# Altium schematic sheet Upliance_Power_sequnecing_assignment1_SCH.schdoc
size 426 x 302 mm; Name: A_A3; Symbol: A_A3; Device: A_A3; @Project Name: POWER SEQUENCING; REV: 1.0; Date: 2025-04-19; Sheet: 1/1; Draw By: Yusuf; Convert to PCB: yes *; Add into BOM: yes; spicePre: .; SheetNumber: 2; SheetTotal: 17
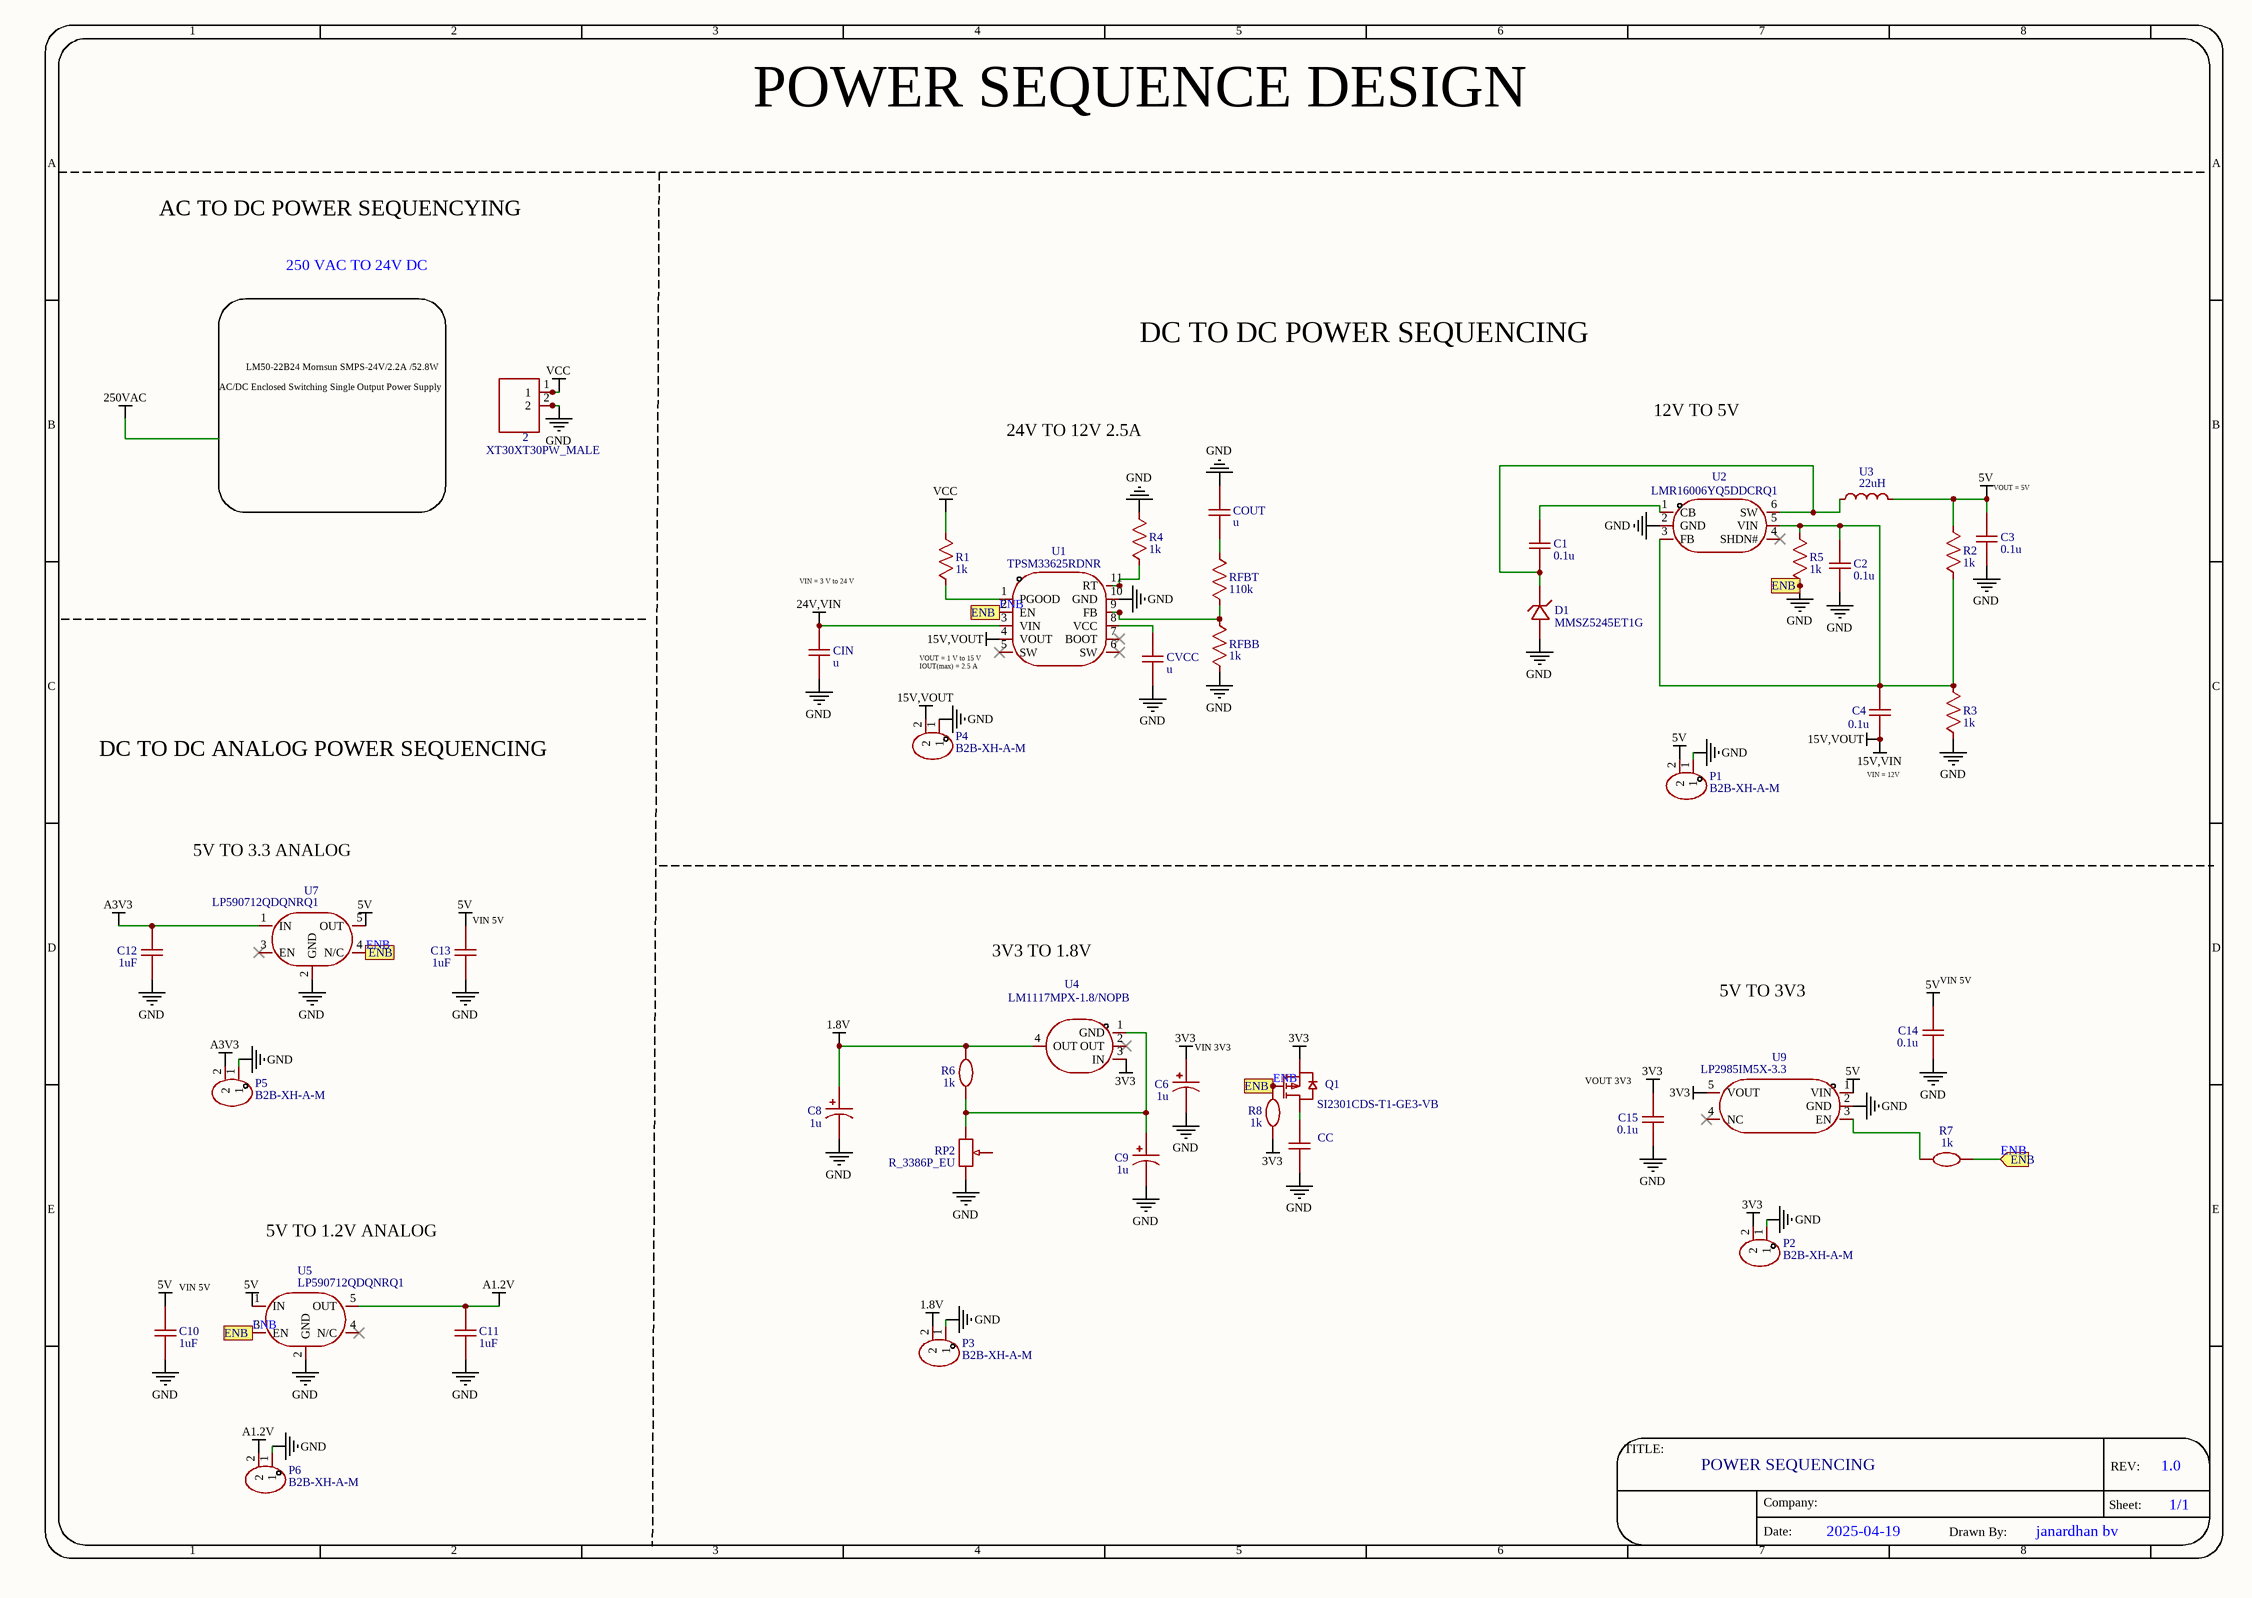
[diagram p0: Upliance_Power_sequnecing_assignment1_SCH.schdoc]

## Parts
2  XT30XT30PW_MALE
C1  0.1u  [C0603]
C2  0.1u  [C0603]
C3  0.1u  [C0603]
C4  0.1u  [C0603]
C6  1u  [CASE-A_3216]
C8  1u  [CASE-A_3216]
C9  1u  [CASE-A_3216]
C10  1uF  [C0603]
C11  1uF  [C0603]
C12  1uF  [C0603]
C13  1uF  [C0603]
C14  0.1u  [C0603]
C15  0.1u  [C0603]
CC  0.1u  [C0603]  (value not drawn)
CIN  u  [C0603]
COUT  u  [C0603]
CVCC  u  [C0603]
D1  MMSZ5245ET1G  [SOD-123_L2.7-W1.6-LS3.7-RD]
P1  B2B-XH-A-M  [CONN-TH_B2B-XH-A-M]
P2  B2B-XH-A-M  [CONN-TH_B2B-XH-A-M]
P3  B2B-XH-A-M  [CONN-TH_B2B-XH-A-M]
P4  B2B-XH-A-M  [CONN-TH_B2B-XH-A-M]
P5  B2B-XH-A-M  [CONN-TH_B2B-XH-A-M]
P6  B2B-XH-A-M  [CONN-TH_B2B-XH-A-M]
Q1  SI2301CDS-T1-GE3-VB  [SOT-23-3_L2.9-W1.3-P1.90-LS2.4-BR]
R1  1k  [R0603]
R2  1k  [R0603]
R3  1k  [R0603]
R4  1k  [R0603]
R5  1k  [R0603]
R6  1k  [R0603]
R7  1k  [R0603]
R8  1k  [R0603]
RFBB  1k  [R0603]
RFBT  110k  [R0603]
RP2  R_3386P_EU  [RES-ADJ-TH_3386P]
U1  TPSM33625RDNR  [QFN-11_L4.5-W3.5-P0.50-TL_TPSM365R6FRDNR]
U2  LMR16006YQ5DDCRQ1  [TSOT-23-6_L2.9-W1.6-P0.95-LS2.8-BR]
U3  22uH  [IND-SMD_L2.1-W1.5]
U4  LM1117MPX-1.8/NOPB  [SOT-223-4_L6.5-W3.5-P2.30-LS7.0-BR]
U5  LP590712QDQNRQ1  [SOT-23-5_L3.0-W1.7-P0.95-LS2.8-BR]
U7  LP590712QDQNRQ1  [SOT-23-5_L3.0-W1.7-P0.95-LS2.8-BR]
U9  LP2985IM5X-3.3  [SOT-23-5_L2.9-W1.6-P0.95-LS2.8-BR]

## Ports
ENB (in)

## Nets
1.8V: C8.1 P3.2 R6.2 U4.4(OUT)
3V3: C6.1 C15.2 P2.2 Q1.2(S) R8.1 U4.3(IN) U9.5(VOUT)
5V: C3.2 C10.2 C13.2 C14.1 P1.2 R2.1 U3.2 U5.1(IN) U7.5(OUT) U9.1(VIN)
15V,VIN: C4.1 P4.2 U1.4(VOUT)  [also labelled 15V,VOUT]
24V,VIN: CIN.2 U1.3(VIN)
A1.2V: C11.1 P6.2 U5.5(OUT)
A3V3: C12.1 P5.2 U7.1(IN)
ENB: 2.2 C2.1 C3.1 C6.2 C8.2 C9.2 C10.1 C11.2 C12.2 C13.1 C14.2 C15.1 CC.2 CIN.1 COUT.1 CVCC.1 D1.2(A) P1.1 P2.1 P3.1 P4.1 P5.1 P6.1 Q1.1(G) R3.2 R4.2 R5.1 R7.2 R8.2 RFBB.2 RP2.1 U1.2(EN) U1.10(GND) U2.2(GND) U5.2(GND) U5.3(EN) U7.2(GND) U7.4(N/C) U9.2(GND) ; port ENB  [also labelled GND]
VCC: 2.1 R1.2
NetC1_1: C1.1 D1.1(C) U2.6(SW) U3.1
NetC1_2: C1.2 U2.1(CB)
NetC2_2: C2.2 C4.2 R2.2 R3.1 R5.2 U2.3(FB) U2.5(VIN)
NetC9_1: C9.1 R6.1 RP2.3 U4.1(GND)
NetCC_1: CC.1 Q1.3(D)
NetCOUT_2: COUT.2 RFBT.2
NetCVCC_2: CVCC.2 U1.8(VCC)
NetR1_1: R1.1 U1.1(PGOOD)
NetR4_1: R4.1 U1.11(RT)
NetR7_1: R7.1 U9.3(EN)
NetRFBB_1: RFBB.1 RFBT.1 U1.9(FB)

Not connected (* = marked no-connect by the designer): RP2 2; U1 5(SW)* 6(SW)* 7(BOOT)*; U2 4(SHDN#)*; U4 2(OUT)*; U5 4(N/C)*; U7 3(EN)*; U9 4(NC)*

## Notes on the sheet
- POWER SEQUENCE DESIGN
- AC TO DC POWER SEQUENCYING
- 250 VAC TO 24V DC
- DC TO DC POWER SEQUENCING
- AC/DC Enclosed Switching Single Output Power Supply
- LM50-22B24 Mornsun SMPS-24V/2.2A /52.8W
- 12V TO 5V
- 24V TO 12V 2.5A
- (near C3) VOUT = 5V
- (near CIN) VIN = 3 V to 24 V
- DC TO DC ANALOG POWER SEQUENCING
- VOUT = 1 V to 15 V
  IOUT(max) = 2.5 A
- VIN = 12V
- 5V TO 3.3 ANALOG
- (near C13) VIN 5V
- 3V3 TO 1.8V
- 5V TO 3V3
- (near C14) VIN 5V
- (near C6) VIN 3V3
- (near C15) VOUT 3V3
- 5V TO 1.2V ANALOG
- (near C10) VIN 5V
- 1
- 2
- 3
- 4
- 5
- 6
- 7
- 8
- A
- B
- C
- D
- E
- TITLE:
- POWER SEQUENCING
- REV:
- 1.0
- Date:
- Company:
- 2025-04-19
- Drawn By:
- janardhan bv
- Sheet:
- 1/1

## Library data of the parts
2 = XT30XT30PW_MALE: Convert to PCB: yes; Contributor: akun pang; Symbol: XT30XT30PW_MALE; Device: XT30XT30PW_MALE; Add into BOM: yes; Origin Footprint: XT30PW_MALE; spicePre: ?; spiceSymbolName: XT30XT30PW_MALE
C1-C4 C14 C15 CC = 0.1u: Convert to PCB: yes; nameAlias: Value(F); Contributor: LCEDA_Lib; Symbol: 0.1u; Device: 0.1u; Add into BOM: yes; Origin Footprint: C0603; spicePre: C; spiceSymbolName: C_0603_US
C6 C8 C9 = 1u: Convert to PCB: yes; nameAlias: Value(F); Contributor: LCEDA_Lib; Symbol: 1u; Device: 1u; Add into BOM: yes; Origin Footprint: CASE-A_3216; spicePre: C; spiceSymbolName: C_Tan_SMD_A_US
C10-C13 = 1uF: Convert to PCB: yes; nameAlias: Value(F); Contributor: LCEDA_Lib; Symbol: 1uF; Device: 1uF; Add into BOM: yes; Origin Footprint: C0603; spicePre: C; spiceSymbolName: C_0603_US
CIN COUT CVCC = u: Convert to PCB: yes; nameAlias: Value(F); Contributor: LCEDA_Lib; Symbol: u; Device: u; Add into BOM: yes; Origin Footprint: C0603; spicePre: C; spiceSymbolName: C_0603_US
D1 = MMSZ5245ET1G: Manufacturer: onsemi(安森美); Convert to PCB: yes; Contributor: LCSC; Symbol: MMSZ5245ET1G; Device: MMSZ5245ET1G; Supplier: LCSC; Supplier Part: C463089; Manufacturer Part: MMSZ5245ET1G; JLCPCB Part Class: Extended Part; Add into BOM: yes; Origin Footprint: SOD-123_L2.7-W1.6-LS3.7-RD; spicePre: D; spiceSymbolName: MMSZ5245ET1G
P1-P6 = B2B-XH-A-M: Manufacturer: JST; Manufacturer Part: B2B-XH-A-MB2P-VH（SMT业务专用）; Convert to PCB: yes; Contributor: LCSC; Symbol: B2B-XH-A-M; Device: B2B-XH-A-M; Supplier: LCSC; Supplier Part: C2683608; JLCPCB Part Class: Extended Part; Add into BOM: yes; Origin Footprint: CONN-TH_B2B-XH-A-M; spicePre: U; spiceSymbolName: B2B-XH-A-M
Q1 = SI2301CDS-T1-GE3-VB: Manufacturer: VBsemi(微碧半导体); Convert to PCB: yes; Contributor: lcsc; Symbol: SI2301CDS-T1-GE3-VB; Device: SI2301CDS-T1-GE3-VB; Supplier: LCSC; Supplier Part: C5438957; Manufacturer Part: SI2301CDS-T1-GE3-VB; JLCPCB Part Class: Extended Part; Add into BOM: yes; Origin Footprint: SOT-23-3_L2.9-W1.3-P1.90-LS2.4-BR; spicePre: Q; spiceSymbolName: SI2301CDS-T1-GE3-VB
R1-R8 RFBB = 1k: Convert to PCB: yes; nameAlias: Value(Ω); Contributor: LCEDA_Lib; Symbol: 1k; Device: 1k; Add into BOM: yes; Origin Footprint: R0603; spicePre: R
  R1-R5 RFBB: spiceSymbolName: R_0603_US
  R6-R8: spiceSymbolName: R_0603_EU
RFBT = 110k: Convert to PCB: yes; nameAlias: Value(Ω); Contributor: LCEDA_Lib; Symbol: 110k; Device: 110k; Add into BOM: yes; Origin Footprint: R0603; spicePre: R; spiceSymbolName: R_0603_US
RP2 = R_3386P_EU: Value(Ω): 10K; Convert to PCB: yes; nameAlias: Resistance (Ohms); Contributor: LCEDA_Lib; Symbol: R_3386P_EU; Device: R_3386P_EU; Supplier: LCSC; Add into BOM: yes; Origin Footprint: RES-ADJ-TH_3386P; spicePre: R; spiceSymbolName: R_3386P_EU
U1 = TPSM33625RDNR: Manufacturer: TI(德州仪器); Convert to PCB: yes; Contributor: lcsc; Symbol: TPSM33625RDNR; Device: TPSM33625RDNR; Supplier: LCSC; Supplier Part: C7073593; Manufacturer Part: TPSM33625RDNR; JLCPCB Part Class: Extended Part; Add into BOM: yes; Origin Footprint: QFN-11_L4.5-W3.5-P0.50-TL_TPSM365R6FRDNR; spicePre: U; spiceSymbolName: TPSM33625RDNR
U2 = LMR16006YQ5DDCRQ1: Manufacturer: TI(德州仪器); Convert to PCB: yes; Contributor: lcsc; Symbol: LMR16006YQ5DDCRQ1; Device: LMR16006YQ5DDCRQ1; Supplier: LCSC; Supplier Part: C962072; Manufacturer Part: LMR16006YQ5DDCRQ1; JLCPCB Part Class: Extended Part; Add into BOM: yes; Origin Footprint: TSOT-23-6_L2.9-W1.6-P0.95-LS2.8-BR; spicePre: U; spiceSymbolName: LMR16006YQ5DDCRQ1
U3 = 22uH: Manufacturer: SOREDE(索瑞达); Manufacturer Part: SNR.201610.SYB220MT00; Convert to PCB: yes; Contributor: lcsc; nameAlias: Value; Symbol: 22uH; Device: 22uH; Supplier: LCSC; Supplier Part: C5122815; JLCPCB Part Class: Extended Part; Add into BOM: yes; Origin Footprint: IND-SMD_L2.1-W1.5; spicePre: U; spiceSymbolName: SNR.201610.SYB220MT00
U4 = LM1117MPX-1.8/NOPB: Manufacturer: TI(德州仪器); Convert to PCB: yes; Contributor: LCSC; Symbol: LM1117MPX-1.8/NOPB; Device: LM1117MPX-1.8/NOPB; Supplier: LCSC; Supplier Part: C2877970; Manufacturer Part: LM1117MPX-1.8/NOPB; JLCPCB Part Class: Extended Part; Add into BOM: yes; Origin Footprint: SOT-223-4_L6.5-W3.5-P2.30-LS7.0-BR; spicePre: U; spiceSymbolName: LM1117MPX-1.8/NOPB
U5 U7 = LP590712QDQNRQ1: Manufacturer: TI(德州仪器); Manufacturer Part: LP5907MFX-1.8/NOPB; Convert to PCB: yes; Symbol: LP590712QDQNRQ1; Device: LP590712QDQNRQ1; Supplier: LCSC; Supplier Part: C92498; JLCPCB Part Class: Extended Part; Add into BOM: yes; Origin Footprint: SOT-23-5_L3.0-W1.7-P0.95-LS2.8-BR; spicePre: U; spiceSymbolName: LP5907MFX-1.8/NOPB
U9 = LP2985IM5X-3.3: Manufacturer: TECH PUBLIC(台舟); Convert to PCB: yes; Contributor: lcsc; Symbol: LP2985IM5X-3.3; Device: LP2985IM5X-3.3; Supplier: LCSC; Supplier Part: C5380655; Manufacturer Part: LP2985IM5X-3.3; JLCPCB Part Class: Extended Part; Add into BOM: yes; Origin Footprint: SOT-23-5_L2.9-W1.6-P0.95-LS2.8-BR; spicePre: U; spiceSymbolName: LP2985IM5X-3.3